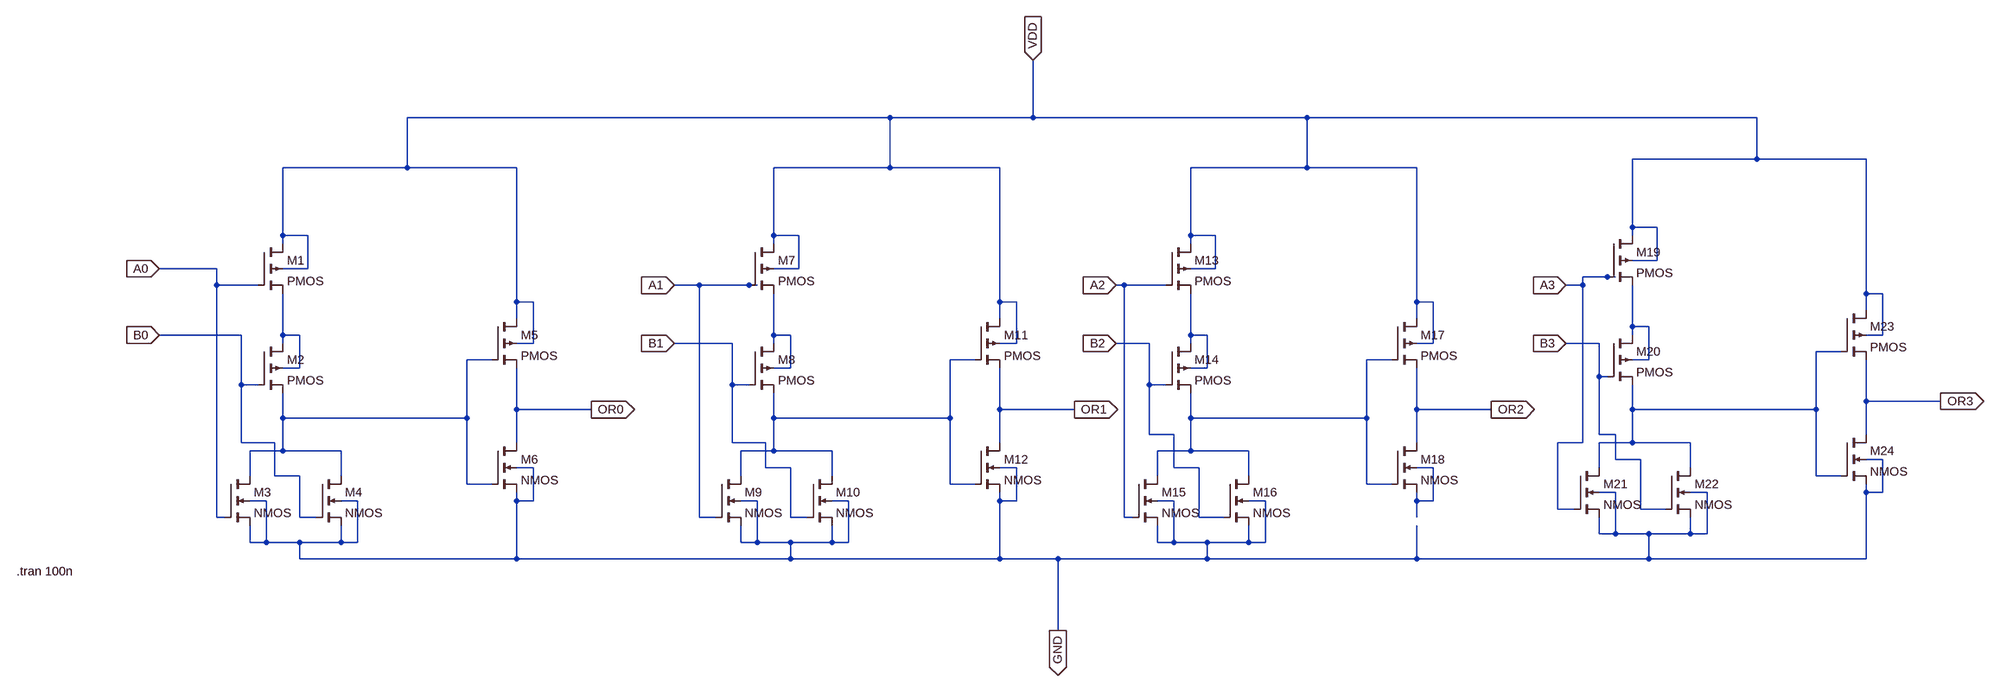
[diagram p0: schematic 4bit_Or.asc]
4bit_Or.asc, the LTspice schematic file:
Version 4.1
SHEET 1 3680 680
WIRE 1472 -672 528 -672
WIRE 1776 -672 1776 -800
WIRE 1776 -672 1472 -672
WIRE 2304 -672 1776 -672
WIRE 3200 -672 2304 -672
WIRE 3200 -592 3200 -672
WIRE 3200 -592 2960 -592
WIRE 3424 -592 3200 -592
WIRE 528 -576 528 -672
WIRE 528 -576 288 -576
WIRE 752 -576 528 -576
WIRE 1472 -576 1472 -672
WIRE 1472 -576 1248 -576
WIRE 1712 -576 1472 -576
WIRE 2304 -576 2304 -672
WIRE 2304 -576 2080 -576
WIRE 2544 -576 2304 -576
WIRE 2960 -384 2960 -592
WIRE 3008 -384 2960 -384
WIRE 288 -368 288 -576
WIRE 336 -368 288 -368
WIRE 1248 -368 1248 -576
WIRE 1296 -368 1248 -368
WIRE 2080 -368 2080 -576
WIRE 2128 -368 2080 -368
WIRE 2960 -368 2960 -384
WIRE 288 -352 288 -368
WIRE 1248 -352 1248 -368
WIRE 2080 -352 2080 -368
WIRE 3008 -320 3008 -384
WIRE 3008 -320 2960 -320
WIRE 160 -304 -112 -304
WIRE 336 -304 336 -368
WIRE 336 -304 288 -304
WIRE 1296 -304 1296 -368
WIRE 1296 -304 1248 -304
WIRE 2128 -304 2128 -368
WIRE 2128 -304 2080 -304
WIRE 2912 -288 2864 -288
WIRE 2928 -288 2912 -288
WIRE 160 -272 160 -304
WIRE 240 -272 160 -272
WIRE 1104 -272 1056 -272
WIRE 1200 -272 1104 -272
WIRE 1216 -272 1200 -272
WIRE 1952 -272 1936 -272
WIRE 2032 -272 1952 -272
WIRE 2864 -272 2864 -288
WIRE 2864 -272 2832 -272
WIRE 3424 -256 3424 -592
WIRE 3456 -256 3424 -256
WIRE 752 -240 752 -576
WIRE 784 -240 752 -240
WIRE 1712 -240 1712 -576
WIRE 1744 -240 1712 -240
WIRE 2544 -240 2544 -576
WIRE 2576 -240 2544 -240
WIRE 3424 -224 3424 -256
WIRE 752 -208 752 -240
WIRE 1712 -208 1712 -240
WIRE 2544 -208 2544 -240
WIRE 2960 -192 2960 -272
WIRE 2992 -192 2960 -192
WIRE 208 -176 -112 -176
WIRE 288 -176 288 -256
WIRE 320 -176 288 -176
WIRE 1248 -176 1248 -256
WIRE 1280 -176 1248 -176
WIRE 2080 -176 2080 -256
WIRE 2112 -176 2080 -176
WIRE 2960 -176 2960 -192
WIRE 3456 -176 3456 -256
WIRE 3456 -176 3424 -176
WIRE 288 -160 288 -176
WIRE 784 -160 784 -240
WIRE 784 -160 752 -160
WIRE 1168 -160 1056 -160
WIRE 1248 -160 1248 -176
WIRE 1744 -160 1744 -240
WIRE 1744 -160 1712 -160
WIRE 2000 -160 1936 -160
WIRE 2080 -160 2080 -176
WIRE 2576 -160 2576 -240
WIRE 2576 -160 2544 -160
WIRE 2896 -160 2832 -160
WIRE 3376 -144 3328 -144
WIRE 704 -128 656 -128
WIRE 1664 -128 1616 -128
WIRE 2496 -128 2448 -128
WIRE 2992 -128 2992 -192
WIRE 2992 -128 2960 -128
WIRE 320 -112 320 -176
WIRE 320 -112 288 -112
WIRE 1280 -112 1280 -176
WIRE 1280 -112 1248 -112
WIRE 2112 -112 2112 -176
WIRE 2112 -112 2080 -112
WIRE 2896 -96 2896 -160
WIRE 2912 -96 2896 -96
WIRE 208 -80 208 -176
WIRE 240 -80 208 -80
WIRE 1168 -80 1168 -160
WIRE 1200 -80 1168 -80
WIRE 2000 -80 2000 -160
WIRE 2032 -80 2000 -80
WIRE 3424 -48 3424 -128
WIRE 3568 -48 3424 -48
WIRE 752 -32 752 -112
WIRE 896 -32 752 -32
WIRE 1712 -32 1712 -112
WIRE 1856 -32 1712 -32
WIRE 2544 -32 2544 -112
WIRE 2688 -32 2544 -32
WIRE 2960 -32 2960 -80
WIRE 3328 -32 3328 -144
WIRE 3328 -32 2960 -32
WIRE 288 -16 288 -64
WIRE 656 -16 656 -128
WIRE 656 -16 288 -16
WIRE 1248 -16 1248 -64
WIRE 1616 -16 1616 -128
WIRE 1616 -16 1248 -16
WIRE 2080 -16 2080 -64
WIRE 2448 -16 2448 -128
WIRE 2448 -16 2080 -16
WIRE 2000 16 2000 -80
WIRE 2048 16 2000 16
WIRE 2896 16 2896 -96
WIRE 2928 16 2896 16
WIRE 3424 16 3424 -48
WIRE 208 32 208 -80
WIRE 272 32 208 32
WIRE 752 32 752 -32
WIRE 1168 32 1168 -80
WIRE 1232 32 1168 32
WIRE 1712 32 1712 -32
WIRE 2544 32 2544 -32
WIRE 2864 32 2864 -272
WIRE 2864 32 2816 32
WIRE 2960 32 2960 -32
WIRE 2960 32 2896 32
WIRE 3072 32 2960 32
WIRE 288 48 288 -16
WIRE 288 48 224 48
WIRE 400 48 288 48
WIRE 1248 48 1248 -16
WIRE 1248 48 1184 48
WIRE 1360 48 1248 48
WIRE 2080 48 2080 -16
WIRE 2080 48 2016 48
WIRE 2192 48 2080 48
WIRE 2928 64 2928 16
WIRE 2976 64 2928 64
WIRE 3456 64 3424 64
WIRE 784 80 752 80
WIRE 1232 80 1232 32
WIRE 1280 80 1232 80
WIRE 1744 80 1712 80
WIRE 2048 80 2048 16
WIRE 2096 80 2048 80
WIRE 2576 80 2544 80
WIRE 2896 80 2896 32
WIRE 3072 80 3072 32
WIRE 224 96 224 48
WIRE 272 96 272 32
WIRE 320 96 272 96
WIRE 400 96 400 48
WIRE 1184 96 1184 48
WIRE 1360 96 1360 48
WIRE 2016 96 2016 48
WIRE 2192 96 2192 48
WIRE 3328 96 3328 -32
WIRE 3376 96 3328 96
WIRE 656 112 656 -16
WIRE 704 112 656 112
WIRE 1616 112 1616 -16
WIRE 1664 112 1616 112
WIRE 2448 112 2448 -16
WIRE 2496 112 2448 112
WIRE 2928 128 2896 128
WIRE 3104 128 3072 128
WIRE 3424 128 3424 112
WIRE 3456 128 3456 64
WIRE 3456 128 3424 128
WIRE 256 144 224 144
WIRE 432 144 400 144
WIRE 752 144 752 128
WIRE 784 144 784 80
WIRE 784 144 752 144
WIRE 1216 144 1184 144
WIRE 1392 144 1360 144
WIRE 1712 144 1712 128
WIRE 1744 144 1744 80
WIRE 1744 144 1712 144
WIRE 2048 144 2016 144
WIRE 2224 144 2192 144
WIRE 2544 144 2544 128
WIRE 2576 144 2576 80
WIRE 2576 144 2544 144
WIRE 2816 160 2816 32
WIRE 2848 160 2816 160
WIRE 2976 160 2976 64
WIRE 3024 160 2976 160
WIRE 160 176 160 -272
WIRE 176 176 160 176
WIRE 320 176 320 96
WIRE 352 176 320 176
WIRE 1104 176 1104 -272
WIRE 1136 176 1104 176
WIRE 1280 176 1280 80
WIRE 1312 176 1280 176
WIRE 1952 176 1952 -272
WIRE 1968 176 1952 176
WIRE 2096 176 2096 80
WIRE 2144 176 2096 176
WIRE 2544 176 2544 144
WIRE 2896 208 2896 176
WIRE 2928 208 2928 128
WIRE 2928 208 2896 208
WIRE 2992 208 2928 208
WIRE 3072 208 3072 176
WIRE 3072 208 2992 208
WIRE 3104 208 3104 128
WIRE 3104 208 3072 208
WIRE 224 224 224 192
WIRE 256 224 256 144
WIRE 256 224 224 224
WIRE 320 224 256 224
WIRE 400 224 400 192
WIRE 400 224 320 224
WIRE 432 224 432 144
WIRE 432 224 400 224
WIRE 1184 224 1184 192
WIRE 1216 224 1216 144
WIRE 1216 224 1184 224
WIRE 1280 224 1216 224
WIRE 1360 224 1360 192
WIRE 1360 224 1280 224
WIRE 1392 224 1392 144
WIRE 1392 224 1360 224
WIRE 2016 224 2016 192
WIRE 2048 224 2048 144
WIRE 2048 224 2016 224
WIRE 2112 224 2048 224
WIRE 2192 224 2192 192
WIRE 2192 224 2112 224
WIRE 2224 224 2224 144
WIRE 2224 224 2192 224
WIRE 320 256 320 224
WIRE 752 256 752 144
WIRE 752 256 320 256
WIRE 1280 256 1280 224
WIRE 1280 256 752 256
WIRE 1712 256 1712 144
WIRE 1712 256 1280 256
WIRE 1824 256 1712 256
WIRE 2112 256 2112 224
WIRE 2112 256 1824 256
WIRE 2544 256 2544 192
WIRE 2544 256 2112 256
WIRE 2992 256 2992 208
WIRE 2992 256 2544 256
WIRE 3424 256 3424 128
WIRE 3424 256 2992 256
WIRE 1824 496 1824 256
FLAG 896 -32 OR0
IOPIN 896 -32 Out
FLAG 1856 -32 OR1
IOPIN 1856 -32 Out
FLAG 2688 -32 OR2
IOPIN 2688 -32 Out
FLAG 3568 -48 OR3
IOPIN 3568 -48 Out
FLAG 1824 496 GND
IOPIN 1824 496 Out
FLAG 1776 -800 VDD
IOPIN 1776 -800 In
FLAG -112 -304 A0
IOPIN -112 -304 In
FLAG -112 -176 B0
IOPIN -112 -176 In
FLAG 1056 -272 A1
IOPIN 1056 -272 In
FLAG 1056 -160 B1
IOPIN 1056 -160 In
FLAG 1936 -272 A2
IOPIN 1936 -272 In
FLAG 1936 -160 B2
IOPIN 1936 -160 In
FLAG 2832 -272 A3
IOPIN 2832 -272 In
FLAG 2832 -160 B3
IOPIN 2832 -160 In
SYMBOL pmos4 240 -352 R0
SYMATTR InstName M1
SYMBOL pmos4 240 -160 R0
SYMATTR InstName M2
SYMBOL nmos4 176 96 R0
SYMATTR InstName M3
SYMBOL nmos4 352 96 R0
SYMATTR InstName M4
SYMBOL pmos4 704 -208 R0
SYMATTR InstName M5
SYMBOL nmos4 704 32 R0
SYMATTR InstName M6
SYMBOL pmos4 1200 -352 R0
SYMATTR InstName M7
SYMBOL pmos4 1200 -160 R0
SYMATTR InstName M8
SYMBOL nmos4 1136 96 R0
SYMATTR InstName M9
SYMBOL nmos4 1312 96 R0
SYMATTR InstName M10
SYMBOL pmos4 1664 -208 R0
SYMATTR InstName M11
SYMBOL nmos4 1664 32 R0
SYMATTR InstName M12
SYMBOL pmos4 2032 -352 R0
SYMATTR InstName M13
SYMBOL pmos4 2032 -160 R0
SYMATTR InstName M14
SYMBOL nmos4 1968 96 R0
SYMATTR InstName M15
SYMBOL nmos4 2144 96 R0
SYMATTR InstName M16
SYMBOL pmos4 2496 -208 R0
SYMATTR InstName M17
SYMBOL nmos4 2496 32 R0
SYMATTR InstName M18
SYMBOL pmos4 2912 -368 R0
SYMATTR InstName M19
SYMBOL pmos4 2912 -176 R0
SYMATTR InstName M20
SYMBOL nmos4 2848 80 R0
SYMATTR InstName M21
SYMBOL nmos4 3024 80 R0
SYMATTR InstName M22
SYMBOL pmos4 3376 -224 R0
SYMATTR InstName M23
SYMBOL nmos4 3376 16 R0
SYMATTR InstName M24
TEXT -864 280 Left 2 !.tran 100n

The netlist it stands for:
* 4bit_Or.asc
M1 VDD A0 N002 VDD PMOS
M2 N002 B0 N006 N002 PMOS
M3 N006 A0 GND GND NMOS
M4 N006 B0 GND GND NMOS
M5 VDD N006 OR0 VDD PMOS
M6 OR0 N006 GND GND NMOS
M7 VDD A1 N003 VDD PMOS
M8 N003 B1 N007 N003 PMOS
M9 N007 A1 GND GND NMOS
M10 N007 B1 GND GND NMOS
M11 VDD N007 OR1 VDD PMOS
M12 OR1 N007 GND GND NMOS
M13 VDD A2 N004 VDD PMOS
M14 N004 B2 N008 N004 PMOS
M15 N008 A2 GND GND NMOS
M16 N008 B2 GND GND NMOS
M17 VDD N008 OR2 VDD PMOS
M18 OR2 N008 N009 N009 NMOS
M19 VDD A3 N001 VDD PMOS
M20 N001 B3 N005 N001 PMOS
M21 N005 A3 GND GND NMOS
M22 N005 B3 GND GND NMOS
M23 VDD N005 OR3 VDD PMOS
M24 OR3 N005 GND GND NMOS
.model NMOS NMOS
.model PMOS PMOS
.lib standard.mos
.tran 100n
.backanno
.end